# Altium schematic sheet SDCard-MIPI-User.SchDoc
size A4; SheetNumber: 6; SheetTotal: 7
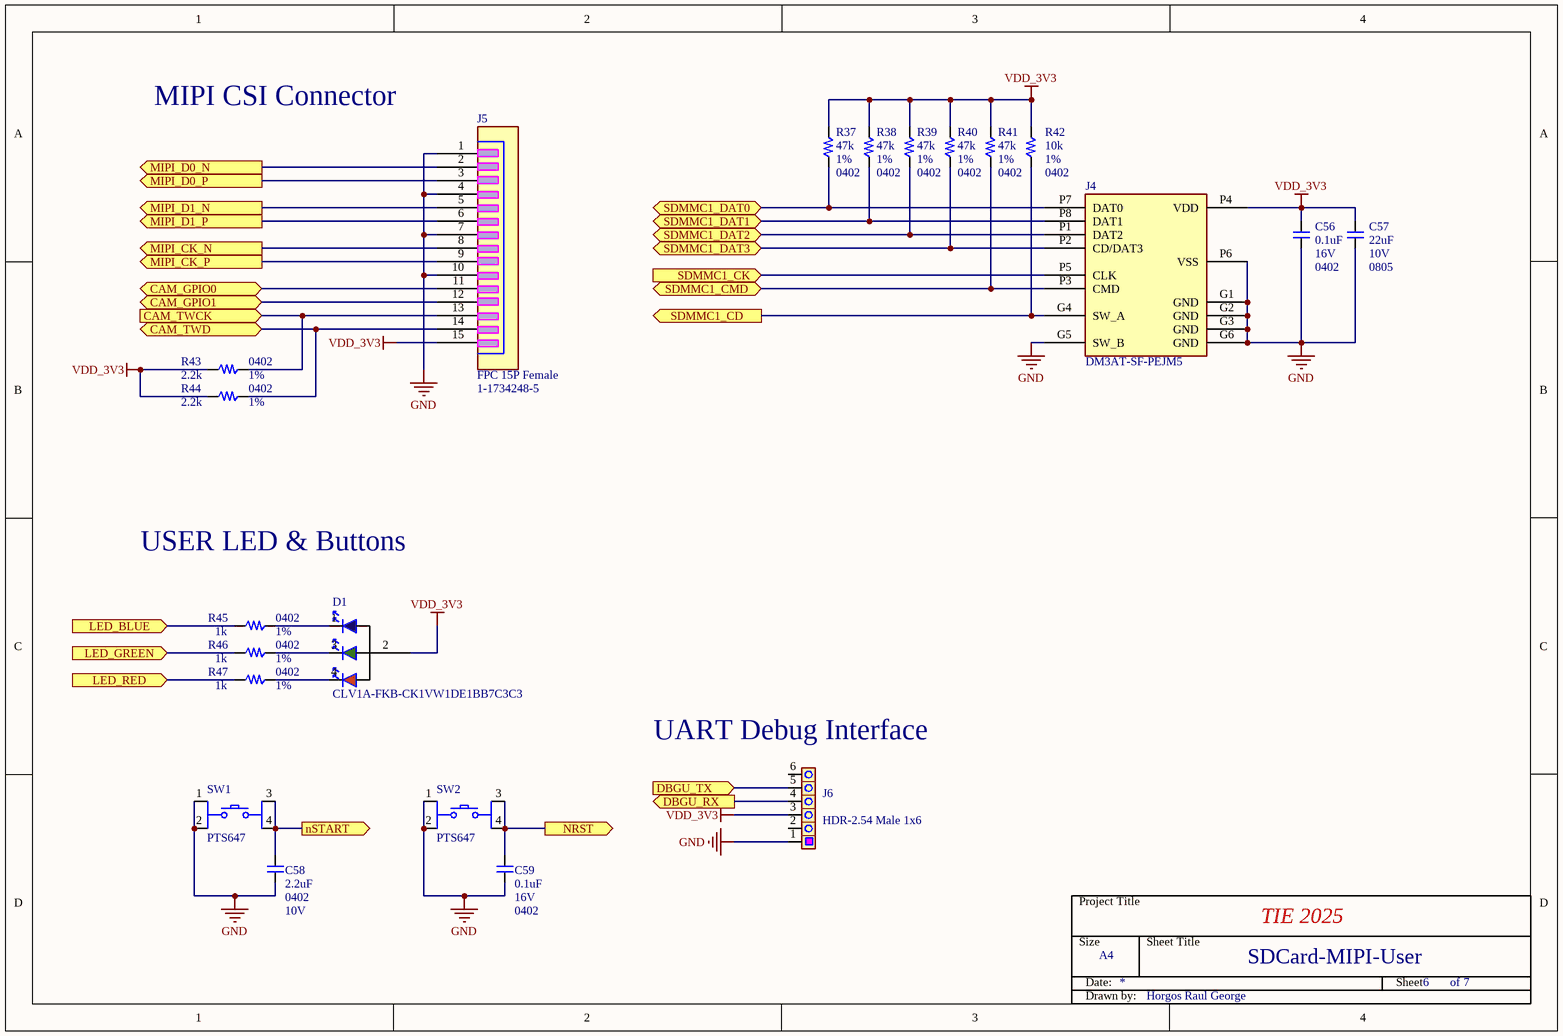
[diagram p0: SDCard-MIPI-User.SchDoc]

## Parts
C56  0.1uF  Rated Voltage: 16V  Package: 0402  [CAP0402]
C57  22uF  Rated Voltage: 10V  Package: 0805  [CAP0805]
C58  2.2uF  Package: 0402  Rated Voltage: 10V  [CAP0402]
C59  0.1uF  Rated Voltage: 16V  Package: 0402  [CAP0402]
D1  APT1608SRCPRV  [CLV1A-FKB-CK1VW1DE1BB7C3C3]  (value not drawn)
J4  DM3AT-SF-PEJM5  [DM3AT-SF-PEJM5]
J5  FPC 15P Female  [1-1734248-5_1]
J6  HDR-2.54 Male 1x6  [68001-106HLF]
R37  47k  Tolerance: 1%  Package: 0402  [RES0402]
R38  47k  Tolerance: 1%  Package: 0402  [RES0402]
R39  47k  Tolerance: 1%  Package: 0402  [RES0402]
R40  47k  Tolerance: 1%  Package: 0402  [RES0402]
R41  47k  Tolerance: 1%  Package: 0402  [RES0402]
R42  10k  Tolerance: 1%  Package: 0402  [RES0402]
R43  2.2k  Tolerance: 1%  Package: 0402  [RES0402]
R44  2.2k  Tolerance: 1%  Package: 0402  [RES0402]
R45  1k  Tolerance: 1%  Package: 0402  [RES0402]
R46  1k  Tolerance: 1%  Package: 0402  [RES0402]
R47  1k  Tolerance: 1%  Package: 0402  [RES0402]
SW1  PTS647  [PTS 647 SK38 SMTR2 LFS]
SW2  PTS647  [PTS 647 SK38 SMTR2 LFS]
Title_6  Title Block  (value not drawn)  (graphical)

## Ports
CAM_GPIO0 (bidir, see MPU-PIO[2A]), CAM_GPIO1 (bidir, see MPU-PIO[2B]), CAM_TWCK (in, see MPU-PIO[4B]), CAM_TWD (bidir, see MPU-PIO[4B]), DBGU_RX (out, see MPU-PIO[1D]), DBGU_TX (in, see MPU-PIO[1C]), LED_BLUE (in, see MPU-PIO[2B]), LED_GREEN (in, see MPU-PIO[1C]), LED_RED (in, see MPU-PIO[1C]), MIPI_CK_N (out, see MPU-System[2B]), MIPI_CK_P (out, see MPU-System[2B]), MIPI_D0_N (out, see MPU-System[2B]), MIPI_D0_P (out, see MPU-System[2B]), MIPI_D1_N (out, see MPU-System[2B]), MIPI_D1_P (out, see MPU-System[2B]), NRST (out, see MPU-System[1A], PMIC[1B]), nSTART (out, see PMIC[1B]), SDMMC1_CD (out, see MPU-PIO[4A]), SDMMC1_CK (in, see MPU-PIO[2B]), SDMMC1_CMD (bidir, see MPU-PIO[2B]), SDMMC1_DAT0 (bidir, see MPU-PIO[2B]), SDMMC1_DAT1 (bidir, see MPU-PIO[4A]), SDMMC1_DAT2 (bidir, see MPU-PIO[4A]), SDMMC1_DAT3 (bidir, see MPU-PIO[4A])

## Nets
GND: C56.1 C57.1 C58.1 C59.1 J4.G1(GND) J4.G2(GND) J4.G3(GND) J4.G5(SW_B) J4.G6(GND) J4.P6(VSS) J5.1 J5.4 J5.7 J5.10 J6.1 SW1.1 SW1.2 SW2.1 SW2.2
VDD_3V3: C56.2 C57.2 D1.2 J4.P4(VDD) J5.15 J6.3 R37.2 R38.2 R39.2 R40.2 R41.2 R42.2 R43.1 R44.1
CAM_GPIO0: J5.11 ; port CAM_GPIO0
CAM_GPIO1: J5.12 ; port CAM_GPIO1
CAM_TWCK: J5.13 R43.2 ; port CAM_TWCK
CAM_TWD: J5.14 R44.2 ; port CAM_TWD
DBGU_RX: J6.4 ; port DBGU_RX
DBGU_TX: J6.5 ; port DBGU_TX
LED_BLUE: R45.1 ; port LED_BLUE
LED_GREEN: R46.1 ; port LED_GREEN
LED_RED: R47.1 ; port LED_RED
MIPI_CK_N: J5.8 ; port MIPI_CK_N
MIPI_CK_P: J5.9 ; port MIPI_CK_P
MIPI_D0_N: J5.2 ; port MIPI_D0_N
MIPI_D0_P: J5.3 ; port MIPI_D0_P
MIPI_D1_N: J5.5 ; port MIPI_D1_N
MIPI_D1_P: J5.6 ; port MIPI_D1_P
NRST: C59.2 SW2.3 SW2.4 ; port NRST
nSTART: C58.2 SW1.3 SW1.4 ; port nSTART
SDMMC1_CD: J4.G4(SW_A) R42.1 ; port SDMMC1_CD
SDMMC1_CK: J4.P5(CLK) ; port SDMMC1_CK
SDMMC1_CMD: J4.P3(CMD) R41.1 ; port SDMMC1_CMD
SDMMC1_DAT0: J4.P7(DAT0) R37.1 ; port SDMMC1_DAT0
SDMMC1_DAT1: J4.P8(DAT1) R38.1 ; port SDMMC1_DAT1
SDMMC1_DAT2: J4.P1(DAT2) R39.1 ; port SDMMC1_DAT2
SDMMC1_DAT3: J4.P2(CD/DAT3) R40.1 ; port SDMMC1_DAT3
NetD1_1: D1.1 R45.2
NetD1_3: D1.3 R46.2
NetD1_4: D1.4 R47.2

Not connected (* = marked no-connect by the designer): J6 2 6

## Notes on the sheet
- MIPI CSI Connector
- USER LED & Buttons
- (near J6) UART Debug Interface
- SDCard-MIPI-User
- (in symbol Title Block) Project Title; TIE 2025; Size; Sheet Title; A4; Date:; Sheet; of; Drawn by:; Horgos Raul George

## Library data of the parts
C56 C59 = C0402C104K4RAC7867: CAP CER 0.1uF 16V 10% X7R SMD 0402; Manufacturer: KEMET; .Checked_PCB: AI; Manufacturer Part Number: C0402C104K4RAC7867; .Checked_SCH: AI; .Creator: AI
C57 = C2012X7S1A226M125AC: CAP CER 22uF 10V 20% X7S SMD 0805; Manufacturer: TDK Corporation; Manufacturer Part Number: C2012X7S1A226M125AC
C58 = GRM155C71A225KE11J: CAP CER 2.2uF 10V 10% X7S SMD 0402; Manufacturer: Murata; .Checked_PCB: AI; Manufacturer Part Number: GRM155C71A225KE11J; .Checked_SCH: AI; .Creator: AI
D1 = CLV1A-FKB-CK1VW1DE1BB7C3C3: DIO LED TRI RED, GREEN, BLUE 2V, 3.2V, 3.2V 20mA, 20mA, / 20mA SMD 4-PLCC; Manufacturer: Cree Inc.; .Checked_PCB: IC; .Checked_SCH: IC; Manufacturer Part Number: CLV1A-FKB-CK1VW1DE1BB7C3C3
J4 = DM3AT-SF-PEJM5: CON FLASH microSD 8+2P Push-Push SMD; Manufacturer: Hirose Electric Co Ltd; Manufacturer Part Number: DM3AT-SF-PEJM5
J5 = 1-1734248-5: CON FPC 1mm 15P Female SMD VERT; Manufacturer: TE Connectivity AMP; Manufacturer Part Number: 1-1734248-5
J6 = 68001-106HLF: CON HDR-2.54 Male 1x6 Gold 5.84MH TH VERT; Manufacturer: FCI; Manufacturer Part Number: 68001-106HLF
R37-R41 = ERJ-2RKF4702X: RES TKF 47k 1% 1/10W SMD 0402 AEC-Q200; Manufacturer: Panasonic - ECG; Manufacturer Part Number: ERJ-2RKF4702X
R42 = ERJ-2RKF1002X: RES TKF 10k 1% 1/10W SMD 0402; Manufacturer: Panasonic; Manufacturer Part Number: ERJ-2RKF1002X
R43 R44 = ERJ-2RKF2201X: RES TKF 2.2k 1% 1/10W SMD 0402; Manufacturer: Panasonic; Manufacturer Part Number: ERJ-2RKF2201X
R45-R47 = ERJ-2RKF1001X: RES TKF 1k 1% 1/10W SMD 0402; Manufacturer: Panasonic; Manufacturer Part Number: ERJ-2RKF1001X
SW1 SW2 = PTS647: SWITCH TACT SPST 12V 50mA PTS 647 SK38 SMTR2 LFSSMD; Manufacturer: C&K; Datasheet Link: https://datasheet.datasheetarchive.com/originals/distributors/Datasheets_SAMA/dda6c2a9a64375c9ffe9508ecade46cd.pdf; Height: 3.8mm; Arrow Part Number: PTS 647 SK38 SMTR2 LFS; Arrow Price/Stock: https://www.arrow.com/en/products/pts-647-sk38-smtr2-lfs/ck?region=europe; Manufacturer Part Number: PTS 647 SK38 SMTR2 LFS